# EasyEDA Pro project qsfp-booster.epro, schematic qsfp-booster
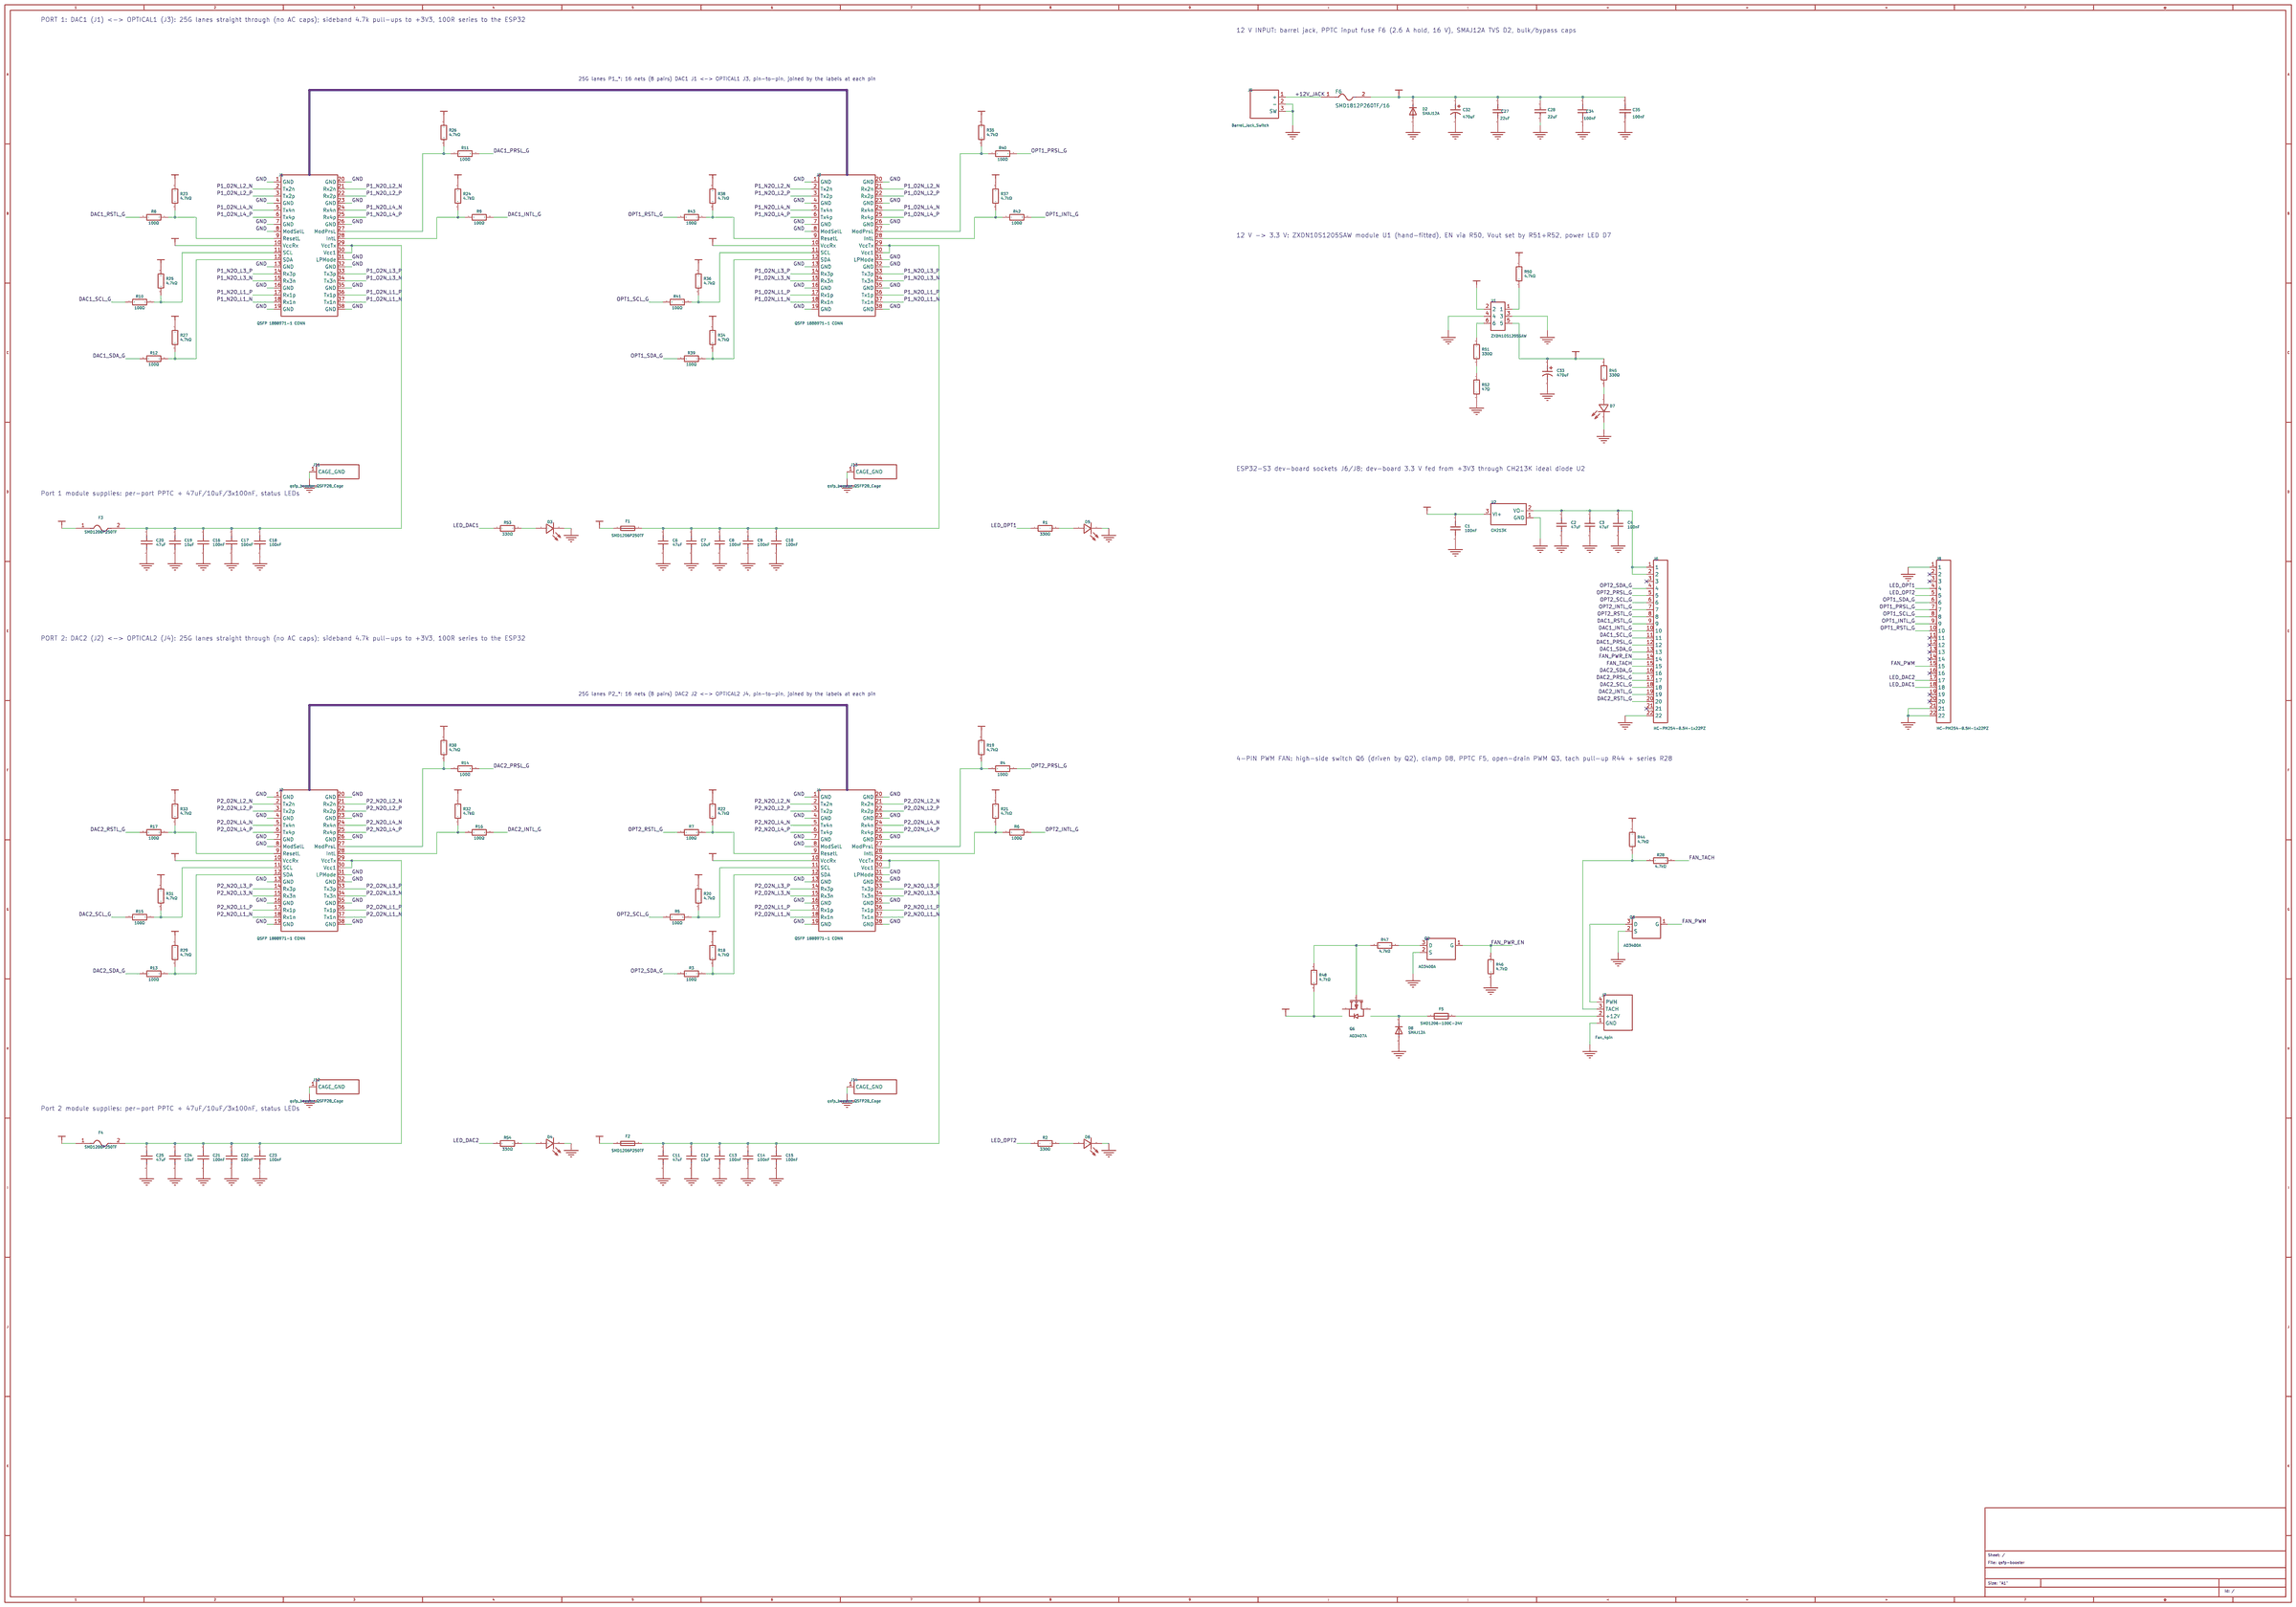
[diagram p0: schematic sheet]

## Parts
C1  100nF  [C0402]
C2  47uF
C3  47uF
C4  100nF
C6  47uF  [C1206]
C7  10uF  [C0805]
C8  100nF  [C0402]
C9  100nF  [C0402]
C10  100nF  [C0402]
C11  47uF  [C1206]
C12  10uF  [C0805]
C13  100nF  [C0402]
C14  100nF  [C0402]
C15  100nF  [C0402]
C16  100nF  [C0402]
C17  100nF  [C0402]
C18  100nF  [C0402]
C19  10uF  [C0805]
C20  47uF  [C1206]
C21  100nF  [C0402]
C22  100nF  [C0402]
C23  100nF  [C0402]
C24  10uF  [C0805]
C25  47uF  [C1206]
C27  22uF  [C1206]
C28  22uF  [C1206]
C32  470uF  [CAP-TH_BD8.0-P3.50-D1.0-FD]  (no BOM)
C33  470uF  [CAP-TH_BD8.0-P3.50-D1.0-FD]  (no BOM)
C34  100nF  [C0402]
C35  100nF  [C0402]
D2  D  [SMA_L4.3-W2.6-LS5.2-RD]
D3  KT-0603W  [LED0603-R-RD_WHITE]
D4  KT-0603W  [LED0603-R-RD_WHITE]
D5  KT-0603W  [LED0603-R-RD_WHITE]
D6  KT-0603W  [LED0603-R-RD_WHITE]
D7  KT-0603W  [LED0603-R-RD_WHITE]
D8  D  [SMA_L4.3-W2.6-LS5.2-RD]
F1  Polyfuse  [F1206]
F2  Polyfuse  [F1206]
F3  Polyfuse  [F1206]
F4  Polyfuse  [F1206]
F5  SMD1206-100C-24V  [F1206]
F6  SMD1812P260TF/16  [F1812]
J1  QSFP28_Receptacle  [CONN-SMD_QSFP-1888971-1]
J2  QSFP28_Receptacle  [CONN-SMD_QSFP-1888971-1]
J3  QSFP28_Receptacle  [CONN-SMD_QSFP-1888971-1]
J4  QSFP28_Receptacle  [CONN-SMD_QSFP-1888971-1]
J5  Barrel_Jack_Switch  [DC-IN-TH_DC-005-5A-2.0]  (no BOM)
J6  HC-PM254-8.5H-1x22PZ  [HDR-TH_22P-P2.54-V-F]  (no BOM)
J7  Fan_4pin  [CONN-TH_47053-1000]  (no BOM)
J8  HC-PM254-8.5H-1x22PZ  [HDR-TH_22P-P2.54-V-F]  (no BOM)
J11  CAGE_DAC1  [QSFP_Cage_SFF8663]  (no BOM)
J12  CAGE_DAC2  [QSFP_Cage_SFF8663]  (no BOM)
J13  CAGE_OPT1  [QSFP_Cage_SFF8663]  (no BOM)
J14  CAGE_OPT2  [QSFP_Cage_SFF8663]  (no BOM)
Q2  NMOS_GSD  [SOT-23-3_L2.9-W1.3-P1.90-LS2.4-BR]
Q3  NMOS_GSD  [SOT-23-3_L2.9-W1.3-P1.90-LS2.4-BR]
Q6  AO3407A  [SOT-23_L2.9-W1.3-P1.90-LS2.4-BR]
R1  330Ω  [R0402]
R2  330Ω  [R0402]
R3  100Ω  [R0402]
R4  100Ω  [R0402]
R5  100Ω  [R0402]
R6  100Ω  [R0402]
R7  100Ω  [R0402]
R8  100Ω  [R0402]
R9  100Ω  [R0402]
R10  100Ω  [R0402]
R11  100Ω  [R0402]
R12  100Ω  [R0402]
R13  100Ω  [R0402]
R14  100Ω  [R0402]
R15  100Ω  [R0402]
R16  100Ω  [R0402]
R17  100Ω  [R0402]
R18  4.7kΩ  [R0402]
R19  4.7kΩ  [R0402]
R20  4.7kΩ  [R0402]
R21  4.7kΩ  [R0402]
R22  4.7kΩ  [R0402]
R23  4.7kΩ  [R0402]
R24  4.7kΩ  [R0402]
R25  4.7kΩ  [R0402]
R26  4.7kΩ  [R0402]
R27  4.7kΩ  [R0402]
R28  4.7kΩ  [R0402]
R29  4.7kΩ  [R0402]
R30  4.7kΩ  [R0402]
R31  4.7kΩ  [R0402]
R32  4.7kΩ  [R0402]
R33  4.7kΩ  [R0402]
R34  4.7kΩ  [R0402]
R35  4.7kΩ  [R0402]
R36  4.7kΩ  [R0402]
R37  4.7kΩ  [R0402]
R38  4.7kΩ  [R0402]
R39  100Ω  [R0402]
R40  100Ω  [R0402]
R41  100Ω  [R0402]
R42  100Ω  [R0402]
R43  100Ω  [R0402]
R44  4.7kΩ  [R0402]
R45  330Ω  [R0402]
R46  4.7kΩ  [R0402]
R47  4.7kΩ  [R0402]
R48  4.7kΩ  [R0402]
R50  4.7kΩ  [R0402]
R51  330Ω  [R0402]
R52  47Ω  [R0402]
R53  330Ω  [R0402]
R54  330Ω  [R0402]
U1  ZXDN10S1205SAW  [COMM-SMD_ZXDN10S1205SAW]  (no BOM)
U2  CH213K  [SOT-23-3_L2.9-W1.6-P1.90-LS2.8-BR]

## Library data of the parts
C1 C8-C10 C13-C18 C21-C23 C34 C35 = CL05B104KB54PNC: 容值:100nF;精度:±10%;额定电压:50V;温度系数:X7R;; LCSC Part Name: 100nF ±10% 50V; Supplier Part: C307331; Manufacturer: SAMSUNG(三星); Supplier Footprint: 0402; JLCPCB Part Class: Basic Part; Datasheet: https://item.szlcsc.com/datasheet/CL05B104KB54PNC/291005.html; Supplier: LCSC; Tolerance: ±10%; Voltage Rating: 50V; Temperature Coefficient: X7R; PCB Layer: Default
C2 C3 = qsfp_booster_C: 容值:47uF;精度:±20%;额定电压:10V;温度系数:X5R;; LCSC Part Name: 47uF ±20% 10V; Supplier Part: C96123; Manufacturer: SAMSUNG(三星); Manufacturer Part: CL31A476MPHNNNE; Supplier Footprint: 1206; JLCPCB Part Class: Basic Part; Datasheet: https://item.szlcsc.com/datasheet/CL31A476MPHNNNE/97327.html; Supplier: LCSC; Tolerance: ±20%; Voltage Rating: 10V; Temperature Coefficient: X5R; PCB Layer: Default
C4 = qsfp_booster_C: 容值:100nF;精度:±10%;额定电压:50V;温度系数:X7R;; LCSC Part Name: 100nF ±10% 50V; Supplier Part: C307331; Manufacturer: SAMSUNG(三星); Manufacturer Part: CL05B104KB54PNC; Supplier Footprint: 0402; JLCPCB Part Class: Basic Part; Datasheet: https://item.szlcsc.com/datasheet/CL05B104KB54PNC/291005.html; Supplier: LCSC; Tolerance: ±10%; Voltage Rating: 50V; Temperature Coefficient: X7R; PCB Layer: Default
C6 C11 C20 C25 = CL31A476MPHNNNE: 容值:47uF;精度:±20%;额定电压:10V;温度系数:X5R;; LCSC Part Name: 47uF ±20% 10V; Supplier Part: C96123; Manufacturer: SAMSUNG(三星); Supplier Footprint: 1206; JLCPCB Part Class: Basic Part; Datasheet: https://item.szlcsc.com/datasheet/CL31A476MPHNNNE/97327.html; Supplier: LCSC; Tolerance: ±20%; Voltage Rating: 10V; Temperature Coefficient: X5R; PCB Layer: Default
C7 C12 C19 C24 = CL21A106KAYNNNE_C15850: 容值:10uF;精度:±10%;额定电压:25V;温度系数:X5R;; LCSC Part Name: 10uF ±10% 25V; Supplier Part: C15850; Manufacturer: SAMSUNG(三星); Manufacturer Part: CL21A106KAYNNNE; Supplier Footprint: 0805; JLCPCB Part Class: Basic Part; Datasheet: https://item.szlcsc.com/datasheet/CL21A106KAYNNNE/16532.html; Supplier: LCSC; Tolerance: ±10%; Voltage Rating: 25V; Temperature Coefficient: X5R; PCB Layer: Default
C27 C28 = CL31A226KAHNNNE: 容值:22uF;精度:±10%;额定电压:25V;温度系数:X5R;; LCSC Part Name: 22uF ±10% 25V; Supplier Part: C12891; Manufacturer: SAMSUNG(三星); Supplier Footprint: 1206; JLCPCB Part Class: Basic Part; Datasheet: https://item.szlcsc.com/datasheet/CL31A226KAHNNNE/13537.html; Supplier: LCSC; Tolerance: ±10%; Voltage Rating: 25V; Temperature Coefficient: X5R; PCB Layer: Default
C32 C33 = NXH25V470M8*15 5.0TP: 容值:470uF;精度:±20%;额定电压:25V;纹波电流:1.33A@100kHz;等效串联电阻(ESR):45mΩ@100kHz;; LCSC Part Name: 470uF ±20% 25V; Supplier Part: C2835696; Manufacturer: SAMYOUNG(韩国三莹); Supplier Footprint: 插件,D8xL15mm; JLCPCB Part Class: Extended Part; Datasheet: https://item.szlcsc.com/datasheet/NXH25V470M8*15%25205.0TP/3000472.html; Supplier: LCSC; Tolerance: ±20%; Voltage Rating: 25V; Ripple Current: 1.33A@100kHz; Equivalent Series Resistance(ESR): 45mΩ@100kHz; Pin Spacing: 3.5mm; Diameter: 8mm; Height - Seated (Max): 15mm; Lifetime: 8000hrs@105℃; Operating Temperature: -40℃~+105℃; Polarity type: 有极性; PCB Layer: Default
D2 = SMAJ12A_C148213: 极性:单向;反向截止电压(Vrwm):12V;钳位电压:19.9V;峰值脉冲电流(Ipp):20.1A@10/1000us;峰值脉冲功率(Ppp):400W@10/1000us;击穿电压(VBR):14.7V;; LCSC Part Name: 单向TVS 12V截止 峰值脉冲电流：20.1A@10/1000us; Supplier Part: C148213; Manufacturer: Littelfuse(美国力特); Manufacturer Part: SMAJ12A; Supplier Footprint: DO-214AC(SMA); JLCPCB Part Class: Extended Part; Datasheet: https://item.szlcsc.com/datasheet/SMAJ12A/159546.html; Supplier: LCSC; Polarity: 单向; Reverse Stand-Off Voltage (Vrwm): 12V; Clamping Voltage: 19.9V; Peak Pulse Current (Ipp): 20.1A@10/1000us; Peak Pulse Power Dissipation (Ppp): 400W@10/1000us; Voltage - Breakdown: 14.7V; Reverse Leakage Current (Ir): 1uA; Number of Channels: 单路; Operating Temperature: -65℃~+150℃; level of protection: IEC 61000-4-4；IEC 61000-4-2; Type: TVS; PCB Layer: Default
D3-D7 = KT-0603W: 灯头类型:1.6mmx0.8mm方形灯头;发光颜色:白色;正向压降(Vf):2.6V~3.1V;功率:100mW;正向电流:5mA;波长:-;二极管配置:独立二极管;透镜颜色:黄色透镜;色温:40000K~100000K;发光强度:360mcd;发光角度:120°;载带方式:正贴;工作温度:-40℃~+85℃;; LCSC Part Name: 0603 白灯 高亮; Supplier Part: C2290; Manufacturer: KENTO; Supplier Footprint: 0603; JLCPCB Part Class: Basic Part; Datasheet: https://item.szlcsc.com/datasheet/KT-0603W/2663.html; Supplier: LCSC; Lamp Holder Type: 1.6mmx0.8mm方形灯头; Illumination Color: 白色; Voltage - Forward(Vf): 2.6V~3.1V; Power(Watts): 100mW; Forward Current: 5mA; Diode Configuration: 独立二极管; Lens Color: 黄色透镜; Color Temperature: 40000K~100000K; Luminous Intensity: 360mcd; Viewing Angle: 120°; Mounting Style: 正贴; Operating Temperature: -40℃~+85℃; PCB Layer: Default
D8 = SMAJ12A_C148213: 极性:单向;反向截止电压(Vrwm):12V;钳位电压:19.9V;峰值脉冲电流(Ipp):20.1A@10/1000us;峰值脉冲功率(Ppp):400W@10/1000us;击穿电压(VBR):14.7V;; LCSC Part Name: 单向TVS 12V截止 峰值脉冲电流：20.1A@10/1000us; Supplier Part: C148213; Manufacturer: Littelfuse(美国力特); Manufacturer Part: SMAJ12A; Supplier Footprint: DO-214AC(SMA); JLCPCB Part Class: Extended Part; Datasheet: https://item.szlcsc.com/datasheet/SMAJ12A/159546.html; Supplier: LCSC; Polarity: 单向; Reverse Stand-Off Voltage (Vrwm): 12V; Clamping Voltage: 19.9V; Peak Pulse Current (Ipp): 20.1A@10/1000us; Peak Pulse Power Dissipation (Ppp): 400W@10/1000us; Voltage - Breakdown: 14.7V; Reverse Leakage Current (Ir): 1uA; Number of Channels: 单路; Operating Temperature: -65℃~+150℃; level of protection: IEC 61000-4-4；IEC 61000-4-2; Type: TVS; Diode Configuration: 独立式; Voltage - Forward(Vf@If): 550mV@3A; Voltage - DC Reverse(Vr): 40V; Current - Rectified: 3A; Operating Junction Temperature Range: -55℃~+125℃; Non-Repetitive Peak Forward Surge Current: 80A; PCB Layer: Default
F1-F4 = SMD1206P250TF: 耐压(Vmax):6V;最大电流(Imax):35A;保持电流(Ihold):2.5A;跳闸电流(Itrip):5A;; LCSC Part Name: 6V 35A 1206 自恢复; Supplier Part: C20803; Manufacturer: RUILON(瑞隆源); Supplier Footprint: 1206; JLCPCB Part Class: Extended Part; Datasheet: https://item.szlcsc.com/datasheet/SMD1206P250TF/21515.html; Supplier: LCSC; Voltage - Max: 6V; Current - Max: 35A; Hold Current: 2.5A; Trip Current: 5A; Power Dissipation: 800mW; Resistance - Initial (Ri) (Min): 10mΩ; Resistance - Post Trip (R1) (Max): 60mΩ; Time to Trip(Max): 2s; Operating Temperature: -40℃~+85℃; Length: 3.6mm; Width: 1.9mm; Height: 1mm; PCB Layer: Default
F5 = SMD1206-100C-24V: 耐压(Vmax):24V;最大电流(Imax):40A;保持电流(Ihold):1A;跳闸电流(Itrip):1.8A;; LCSC Part Name: 24V 1A 1206自恢复; Supplier Part: C2760272; Manufacturer: BNstar(比诺星); Supplier Footprint: 1206; JLCPCB Part Class: Extended Part; Datasheet: https://item.szlcsc.com/datasheet/SMD1206-100C-24V/2880884.html; Supplier: LCSC; Voltage - Max: 24V; Current - Max: 40A; Hold Current: 1A; Trip Current: 1.8A; Power Dissipation: 600mW; Resistance - Initial (Ri) (Min): 50mΩ; Resistance - Post Trip (R1) (Max): 300mΩ; Time to Trip(Max): 300ms; Operating Temperature: -40℃~+85℃; PCB Layer: Default
F6 = SMD1812P260TF/16: 耐压(Vmax):16V;最大电流(Imax):35A;保持电流(Ihold):2.6A;跳闸电流(Itrip):5A;; LCSC Part Name: 16V 2.6A 1812自恢复; Supplier Part: C20814; Manufacturer: RUILON(瑞隆源); Supplier Footprint: 1812; JLCPCB Part Class: Extended Part; Datasheet: https://item.szlcsc.com/datasheet/SMD1812P260TF%252F16/21526.html; Supplier: LCSC; Voltage - Max: 16V; Current - Max: 35A; Hold Current: 2.6A; Trip Current: 5A; Power Dissipation: 800mW; Resistance - Initial (Ri) (Min): 10mΩ; Resistance - Post Trip (R1) (Max): 50mΩ; Time to Trip(Max): 2.5s; Operating Temperature: -40℃~+85℃; Length: 4.73mm; Width: 3.41mm; Height: 1.5mm; PCB Layer: Default
J1-J4 = QSFP 1888971-1 CONN: QSFP+贴片卷盘 SMD 40G; Supplier Part: C52677968; Manufacturer: CND-tek(磁联达); Supplier Footprint: SMD,P=0.8mm,卧贴; JLCPCB Part Class: Extended Part; Datasheet: https://item.szlcsc.com/datasheet/QSFP%25201888971-1%2520CONN/55553957.html; Supplier: LCSC; PCB Layer: Default
J5 = DC-005-5A-2.0: 连接器类型:DC电源插座;安装方式:弯插;触点内径:2mm;触点外径:6.2mm;额定电流:5A;额定电压:24V;工作温度:-20℃~+70℃;; LCSC Part Name: DC电源插座 内径:2mm 外径:6.2mm; Supplier Part: C381116; Manufacturer: XKB Connection(中国星坤); Supplier Footprint: 插件; JLCPCB Part Class: Extended Part; Datasheet: https://item.szlcsc.com/datasheet/DC-005-5A-2.0/353348.html; Supplier: LCSC; Connector Type: DC电源插座; Mounting Type: 弯插; Inside Contact Diameter: 2mm; Outside Contact Diameter: 6.2mm; Current Rating: 5A; Voltage Rating (Max): 24V; Body Height: 11mm; Length: 14mm; Width: 9mm; Operating Temperature: -20℃~+70℃; PCB Layer: Default
J6 J8 = HC-PM254-8.5H-1x22PZ: 插孔结构:1x22P;间距:2.54mm;行距:-;圆孔/方孔:方孔;安装方式:直插;排数:单排;总孔位数:22P;额定电流:3A;额定电压:-;插孔方向:顶部;塑高:8.5mm;触头材质:黄铜;触头镀层:金;工作温度:-40℃~+105℃;; LCSC Part Name: 间距2.54mm 1x22Pin 直插 PC3.0 H8.5; Supplier Part: C41376161; Manufacturer: HC(虹成电子); Supplier Footprint: 插件,P=2.54mm; JLCPCB Part Class: Extended Part; Datasheet: https://item.szlcsc.com/datasheet/HC-PM254-8.5H-1x22PZ/43143860.html; Supplier: LCSC; Holes Structure: 1x22P; Pitch: 2.54mm; Circular Hole / Square Hole: 方孔; Mounting Type: 直插; Number of Rows: 单排; Number of Positions: 22P; Current Rating: 3A; Holes Direction: 顶部; Insulation Height: 8.5mm; Contact Material: 黄铜; Contact Plating: 金; Operating Temperature: -40℃~+105℃; PIN Length: 3mm; PCB Layer: Default
J7 = 470531000: 插针结构:1x4P;间距:2.54mm;安装方式:直插;参考系列:-;总PIN数:4P;排数:1;每排PIN数:4;行距:-;额定电流:-;触头材质:铜合金;触头镀层:锡;工作温度:-;; LCSC Part Name: 1x4P 间距:2.54mm 直插; Supplier Part: C240840; Manufacturer: MOLEX; Supplier Footprint: 插件,P=2.54mm; JLCPCB Part Class: Extended Part; Datasheet: https://www.molex.com/content/dam/molex/molex-dot-com/products/automated/en-us/salesdrawingpdf/470/47053/470531000_sd.pdf?inline\; Supplier: LCSC; Pins Structure: 1x4P; Pitch: 2.54mm; Mounting Type: 直插; Number of Pins: 4P; Number of Rows: 1; Number of PINs Per Row: 4; Contact Material: 铜合金; Contact Plating: 锡; Plastic Material: PA; Flame Retardant Rating: UL94V-2; Color: 白色; Z-Height of the Board: 7.5mm; X-Length of Bottom Edge on Board (Spacing Line): 10.2mm; Y-Width of Bottom Edge on Board: 5.84mm; PCB Layer: Default
J11 J12 = qsfp_booster_QSFP28_Cage: Standard EMI cage; MPN: CND-tek QSFP28 2170703-2 1X1H - verify drawing; LCSC: C52677971; PCB Layer: Default
J13 J14 = qsfp_booster_QSFP28_Cage: Standard EMI cage (no heatsink); MPN: CND-tek QSFP28 2170703-2 1X1H; LCSC: C52677971; PCB Layer: Default
Q2 Q3 = AO3400A_C20917: 数量:1个N沟道;漏源电压(Vdss):30V;连续漏极电流(Id):5.7A;导通电阻(RDS(on)):48mΩ@2.5V;耗散功率(Pd):1.4W;阈值电压(Vgs(th)):1.45V;; LCSC Part Name: N沟道 耐压:30V; Supplier Part: C20917; Manufacturer: AOS; Manufacturer Part: AO3400A; Supplier Footprint: SOT-23; JLCPCB Part Class: Basic Part; Datasheet: https://item.szlcsc.com/datasheet/AO3400A/21629.html; Supplier: LCSC; Number: 1个N沟道; Drain to Source Voltage: 30V; Current - Continuous Drain(Id): 5.7A; RDS(on): 48mΩ@2.5V; Pd - Power Dissipation: 1.4W; Gate Threshold Voltage (Vgs(th)): 1.45V; Gate Charge(Qg): 7nC@10V; Input Capacitance(Ciss): 630pF; Reverse Transfer Capacitance (Crss@Vds): 50pF; Operating Temperature: -55℃~+150℃; Type: N沟道; Output Capacitance(Coss): 75pF; Vgs: ±12V; PCB Layer: Default
Q6 = AO3407A_C347478: 数量:1个P沟道;漏源电压(Vdss):30V;连续漏极电流(Id):4.2A;导通电阻(RDS(on)):37mΩ@10V；52mΩ@4.5V;耗散功率(Pd):1.4W;阈值电压(Vgs(th)):1.8V;; LCSC Part Name: 1个P沟道 耐压:30V 电流:4.2A; Supplier Part: C347478; Manufacturer: UMW(友台半导体); Supplier Footprint: SOT-23; JLCPCB Part Class: Extended Part; Datasheet: https://item.szlcsc.com/datasheet/AO3407A/324138.html; Supplier: LCSC; Number: 1个P沟道; Drain to Source Voltage: 30V; Current - Continuous Drain(Id): 4.2A; RDS(on): 37mΩ@10V；52mΩ@4.5V; Pd - Power Dissipation: 1.4W; Gate Threshold Voltage (Vgs(th)): 1.8V; Gate Charge(Qg): 14.3nC@4.5V; Input Capacitance(Ciss): 700pF; Reverse Transfer Capacitance (Crss@Vds): 75pF; Output Capacitance(Coss): 80pF; PCB Layer: Default
R1 R2 R45 R51 R53 R54 = 0402WGF3300TCE: 电阻类型:厚膜电阻;阻值:330Ω;精度:±1%;功率:62.5mW;工作电压:50V;温度系数:±100ppm/℃;; LCSC Part Name: 330Ω ±1% 62.5mW 厚膜电阻; Supplier Part: C25104; Manufacturer: UNI-ROYAL(厚声); Supplier Footprint: 0402; JLCPCB Part Class: Basic Part; Datasheet: https://item.szlcsc.com/datasheet/0402WGF3300TCE/25847.html; Supplier: LCSC; Type: 厚膜电阻; Tolerance: ±1%; Power(Watts): 62.5mW; Voltage-Supply(Max): 50V; Temperature Coefficient: ±100ppm/℃; Operating Temperature: -55℃~+155℃; PCB Layer: Default
R3-R17 R39-R43 = 0402WGF1000TCE: 电阻类型:厚膜电阻;阻值:100Ω;精度:±1%;功率:62.5mW;工作电压:50V;温度系数:±100ppm/℃;; LCSC Part Name: 厚膜电阻 100Ω ±1%; Supplier Part: C25076; Manufacturer: UNI-ROYAL(厚声); Supplier Footprint: 0402; JLCPCB Part Class: Basic Part; Datasheet: https://item.szlcsc.com/datasheet/0402WGF1000TCE/25819.html; Supplier: LCSC; Type: 厚膜电阻; Tolerance: ±1%; Power(Watts): 62.5mW; Voltage-Supply(Max): 50V; Temperature Coefficient: ±100ppm/℃; Operating Temperature: -55℃~+155℃; PCB Layer: Default
R18-R38 R44 R46-R48 R50 = 0402WGF4701TCE: 电阻类型:厚膜电阻;阻值:4.7kΩ;精度:±1%;功率:62.5mW;工作电压:50V;温度系数:±100ppm/℃;; LCSC Part Name: 厚膜电阻 4.7kΩ ±1%; Supplier Part: C25900; Manufacturer: UNI-ROYAL(厚声); Supplier Footprint: 0402; JLCPCB Part Class: Basic Part; Datasheet: https://item.szlcsc.com/datasheet/0402WGF4701TCE/26643.html; Supplier: LCSC; Type: 厚膜电阻; Tolerance: ±1%; Power(Watts): 62.5mW; Voltage-Supply(Max): 50V; Temperature Coefficient: ±100ppm/℃; Operating Temperature: -55℃~+155℃; PCB Layer: Default
R52 = 0402WGF330JTCE: 电阻类型:厚膜电阻;阻值:47Ω;精度:±1%;功率:62.5mW;工作电压:50V;温度系数:±100ppm/℃;; LCSC Part Name: 47Ω ±1% 62.5mW 厚膜电阻; Supplier Part: C25118; Manufacturer: UNI-ROYAL(厚声); Manufacturer Part: 0402WGF470JTCE; Supplier Footprint: 0402; JLCPCB Part Class: Extended Part; Datasheet: https://item.szlcsc.com/datasheet/0402WGF470JTCE/25861.html; Supplier: LCSC; Type: 厚膜电阻; Tolerance: ±1%; Power(Watts): 62.5mW; Voltage-Supply(Max): 50V; Temperature Coefficient: ±100ppm/℃; Operating Temperature: -55℃~+155℃; PCB Layer: Default
U1 = PZ254V-12-06P-YL: ZTE ZXDN10S1205SAW 12V->3.3V 10A POL module (hand-soldered). 1 EN, 2 VIN, 3/4 GND, 5 VOUT, 6 ADJ. Vout=0.591*(3580+R)/(330+R), R=R51+R52=377 ohm -> 3.31 V; LCSC Part Name: 2x3P 间距:2.54mm 方针 直插; Supplier Part: C42393320; Manufacturer: ZTE; Supplier Footprint: 插件,P=2.54mm; JLCPCB Part Class: Extended Part; Datasheet: https://item.szlcsc.com/datasheet/PZ254V-12-06P-YL/44331134.html; Supplier: LCSC; Pin Structure: 2x3P; Pitch: 2.54mm; Row Spacing: 2.54mm; Circluar Pins/Square Pins: 方针; Mounting Type: 直插; Number of Rows: 双排; Number of Pins: 6P; Current Rating: 3A; Length of Mating Pin: 6.1mm; Insulation Height: 2.5mm; Length of End Connection Pin: 3mm; Contact Material: 黄铜; Operating Temperature: -40℃~+105℃; Color: 黄色; PCB Layer: Default
U2 = CH213K: CH213是一款具有限流功能的低压差理想二极管芯片。该芯片集成了过流保护、短路保护、过温保护、电源极性保护等模块。它支持5V电压下电流不超过1A的直流应用，当VO输出端出现短路等过流情况时，可通过限制输出电流来保护电源系统；当输入电源极性接反时，可保护VO输出端的负载电路; LCSC Part Name: 5V*0.5A低压降二极管芯片 停产; Supplier Part: C5456874; Manufacturer: WCH(南京沁恒); Supplier Footprint: SOT-23-3; JLCPCB Part Class: Extended Part; Datasheet: https://item.szlcsc.com/datasheet/CH213K/6369803.html; Supplier: LCSC; Input Voltage (Vin): 2.2V~5.5V; Continuous Current (Imax): 1A; FET Type: 内置FET; Number of Channels: 1; Voltage - Forward(Vf): 240mV; RDS(on): 240mΩ; Quiescent Current: 3.6uA; Operating Temperature: -40℃~+85℃; Features: 过温保护；反向极性保护；短路保护；反向电流阻断; PCB Layer: Default

## Nets
+3V3: C1.1 C33.1 F1.1 F2.1 F3.1 F4.1 R18.1 R19.1 R20.1 R21.1 R22.1 R23.1 R24.1 R25.1 R26.1 R27.1 R29.1 R30.1 R31.1 R32.1 R33.1 R34.1 R35.1 R36.1 R37.1 R38.1 R44.1 R45.1 U1.5 U2.3(VI+)
+12V: C27.1 C28.1 C32.1 C34.1 C35.1 D2.1(K) F6.2 R48.2 R50.1 U1.2
+12V_JACK: F6.1 J5.1(+)
GND: C1.2 C2.2 C3.2 C4.2 C6.2 C7.2 C8.2 C9.2 C10.2 C11.2 C12.2 C13.2 C14.2 C15.2 C16.2 C17.2 C18.2 C19.2 C20.2 C21.2 C22.2 C23.2 C24.2 C25.2 C27.2 C28.2 C32.2 C33.2 C34.2 C35.2 D2.2(A) D3.2(K) D4.2(K) D5.2(K) D6.2(K) D7.2(K) D8.2(A) J1.1(GND) J1.4(GND) J1.7(GND) J1.8(ModSelL) J1.13(GND) J1.16(GND) J1.19(GND) J1.20(GND) J1.23(GND) J1.26(GND) J1.31(LPMode) J1.32(GND) J1.35(GND) J1.38(GND) J2.1(GND) J2.4(GND) J2.7(GND) J2.8(ModSelL) J2.13(GND) J2.16(GND) J2.19(GND) J2.20(GND) J2.23(GND) J2.26(GND) J2.31(LPMode) J2.32(GND) J2.35(GND) J2.38(GND) J3.1(GND) J3.4(GND) J3.7(GND) J3.8(ModSelL) J3.13(GND) J3.16(GND) J3.19(GND) J3.20(GND) J3.23(GND) J3.26(GND) J3.31(LPMode) J3.32(GND) J3.35(GND) J3.38(GND) J4.1(GND) J4.4(GND) J4.7(GND) J4.8(ModSelL) J4.13(GND) J4.16(GND) J4.19(GND) J4.20(GND) J4.23(GND) J4.26(GND) J4.31(LPMode) J4.32(GND) J4.35(GND) J4.38(GND) J5.2(-) J5.3(SW) J6.22 J7.1(GND) J8.1 J8.21 J8.22 J11.1(CAGE_GND) J12.1(CAGE_GND) J13.1(CAGE_GND) J14.1(CAGE_GND) Q2.2(S) Q3.2(S) R46.2 R52.2 U1.3 U1.4 U2.1(GND)
VCC_DAC1: C16.1 C17.1 C18.1 C19.1 C20.1 F3.2 J1.10(VccRx) J1.29(VccTx) J1.30(Vcc1)
VCC_DAC2: C21.1 C22.1 C23.1 C24.1 C25.1 F4.2 J2.10(VccRx) J2.29(VccTx) J2.30(Vcc1)
VCC_OPT1: C6.1 C7.1 C8.1 C9.1 C10.1 F1.2 J3.10(VccRx) J3.29(VccTx) J3.30(Vcc1)
VCC_OPT2: C11.1 C12.1 C13.1 C14.1 C15.1 F2.2 J4.10(VccRx) J4.29(VccTx) J4.30(Vcc1)
DAC1_INTL: J1.28(IntL) R9.1 R24.2
DAC1_INTL_G: J6.10 R9.2
DAC1_PRSL: J1.27(ModPrsL) R11.1 R26.2
DAC1_PRSL_G: J6.12 R11.2
DAC1_RSTL: J1.9(ResetL) R8.1 R23.2
DAC1_RSTL_G: J6.9 R8.2
DAC1_SCL: J1.11(SCL) R10.1 R25.2
DAC1_SCL_G: J6.11 R10.2
DAC1_SDA: J1.12(SDA) R12.1 R27.2
DAC1_SDA_G: J6.13 R12.2
DAC2_INTL: J2.28(IntL) R16.1 R32.2
DAC2_INTL_G: J6.19 R16.2
DAC2_PRSL: J2.27(ModPrsL) R14.1 R30.2
DAC2_PRSL_G: J6.17 R14.2
DAC2_RSTL: J2.9(ResetL) R17.1 R33.2
DAC2_RSTL_G: J6.20 R17.2
DAC2_SCL: J2.11(SCL) R15.1 R31.2
DAC2_SCL_G: J6.18 R15.2
DAC2_SDA: J2.12(SDA) R13.1 R29.2
DAC2_SDA_G: J6.16 R13.2
DCDC_ADJ: R51.1 U1.6
DCDC_ADJ2: R51.2 R52.1
DCDC_EN: R50.2 U1.1
DEV_3V3: C2.1 C3.1 C4.1 J6.1 J6.2 U2.2(VO-)
FAN_12V: F5.2 J7.2(+12V)
FAN_12V_Q: D8.1(K) F5.1
FAN_PG: Q6.1(G) R47.1 R48.1
FAN_PWM: J8.15 Q3.1(G)
FAN_PWM_OUT: J7.4(PWM) Q3.3(D)
FAN_PWR_EN: J6.14 Q2.1(G) R46.1
FAN_SW_N: Q2.3(D) R47.2
FAN_TACH: J6.15 R28.2
FAN_TACH_RAW: J7.3(TACH) R28.1 R44.2
LED_DAC1: J8.18 R53.1
LED_DAC1_A: D3.1(A) R53.2
LED_DAC2: J8.17 R54.1
LED_DAC2_A: D4.1(A) R54.2
LED_OPT1: J8.4 R1.1
LED_OPT1_A: D5.1(A) R1.2
LED_OPT2: J8.5 R2.1
LED_OPT2_A: D6.1(A) R2.2
OPT1_INTL: J3.28(IntL) R37.2 R42.1
OPT1_INTL_G: J8.9 R42.2
OPT1_PRSL: J3.27(ModPrsL) R35.2 R40.1
OPT1_PRSL_G: J8.7 R40.2
OPT1_RSTL: J3.9(ResetL) R38.2 R43.1
OPT1_RSTL_G: J8.10 R43.2
OPT1_SCL: J3.11(SCL) R36.2 R41.1
OPT1_SCL_G: J8.8 R41.2
OPT1_SDA: J3.12(SDA) R34.2 R39.1
OPT1_SDA_G: J8.6 R39.2
OPT2_INTL: J4.28(IntL) R6.1 R21.2
OPT2_INTL_G: J6.7 R6.2
OPT2_PRSL: J4.27(ModPrsL) R4.1 R19.2
OPT2_PRSL_G: J6.5 R4.2
OPT2_RSTL: J4.9(ResetL) R7.1 R22.2
OPT2_RSTL_G: J6.8 R7.2
OPT2_SCL: J4.11(SCL) R5.1 R20.2
OPT2_SCL_G: J6.6 R5.2
OPT2_SDA: J4.12(SDA) R3.1 R18.2
OPT2_SDA_G: J6.4 R3.2
P1_N2O_L1_N: J1.18(Rx1n) J3.37(Tx1n)
P1_N2O_L1_P: J1.17(Rx1p) J3.36(Tx1p)
P1_N2O_L2_N: J1.21(Rx2n) J3.2(Tx2n)
P1_N2O_L2_P: J1.22(Rx2p) J3.3(Tx2p)
P1_N2O_L3_N: J1.15(Rx3n) J3.34(Tx3n)
P1_N2O_L3_P: J1.14(Rx3p) J3.33(Tx3p)
P1_N2O_L4_N: J1.24(Rx4n) J3.5(Tx4n)
P1_N2O_L4_P: J1.25(Rx4p) J3.6(Tx4p)
P1_O2N_L1_N: J1.37(Tx1n) J3.18(Rx1n)
P1_O2N_L1_P: J1.36(Tx1p) J3.17(Rx1p)
P1_O2N_L2_N: J1.2(Tx2n) J3.21(Rx2n)
P1_O2N_L2_P: J1.3(Tx2p) J3.22(Rx2p)
P1_O2N_L3_N: J1.34(Tx3n) J3.15(Rx3n)
P1_O2N_L3_P: J1.33(Tx3p) J3.14(Rx3p)
P1_O2N_L4_N: J1.5(Tx4n) J3.24(Rx4n)
P1_O2N_L4_P: J1.6(Tx4p) J3.25(Rx4p)
P2_N2O_L1_N: J2.18(Rx1n) J4.37(Tx1n)
P2_N2O_L1_P: J2.17(Rx1p) J4.36(Tx1p)
P2_N2O_L2_N: J2.21(Rx2n) J4.2(Tx2n)
P2_N2O_L2_P: J2.22(Rx2p) J4.3(Tx2p)
P2_N2O_L3_N: J2.15(Rx3n) J4.34(Tx3n)
P2_N2O_L3_P: J2.14(Rx3p) J4.33(Tx3p)
P2_N2O_L4_N: J2.24(Rx4n) J4.5(Tx4n)
P2_N2O_L4_P: J2.25(Rx4p) J4.6(Tx4p)
P2_O2N_L1_N: J2.37(Tx1n) J4.18(Rx1n)
P2_O2N_L1_P: J2.36(Tx1p) J4.17(Rx1p)
P2_O2N_L2_N: J2.2(Tx2n) J4.21(Rx2n)
P2_O2N_L2_P: J2.3(Tx2p) J4.22(Rx2p)
P2_O2N_L3_N: J2.34(Tx3n) J4.15(Rx3n)
P2_O2N_L3_P: J2.33(Tx3p) J4.14(Rx3p)
P2_O2N_L4_N: J2.5(Tx4n) J4.24(Rx4n)
P2_O2N_L4_P: J2.6(Tx4p) J4.25(Rx4p)
PWR_LED_A: D7.1(A) R45.2

Not connected (* = marked no-connect by the designer): J6 3* 21*; J8 2* 3* 11* 12* 13* 14* 16* 19* 20*; Q6 2(S) 3(D)

## Notes on the sheet
- PORT 1: DAC1 (J1) <-> OPTICAL1 (J3): 25G lanes straight through (no AC caps); sideband 4.7k pull-ups to +3V3, 100R series to the ESP32
- 12 V INPUT: barrel jack, PPTC input fuse F6 (2.6 A hold, 16 V), SMAJ12A TVS D2, bulk/bypass caps
- 25G lanes P1_*: 16 nets (8 pairs) DAC1 J1 <-> OPTICAL1 J3, pin-to-pin, joined by the labels at each pin
- 12 V -> 3.3 V: ZXDN10S1205SAW module U1 (hand-fitted), EN via R50, Vout set by R51+R52, power LED D7
- ESP32-S3 dev-board sockets J6/J8; dev-board 3.3 V fed from +3V3 through CH213K ideal diode U2
- Port 1 module supplies: per-port PPTC + 47uF/10uF/3x100nF, status LEDs
- PORT 2: DAC2 (J2) <-> OPTICAL2 (J4): 25G lanes straight through (no AC caps); sideband 4.7k pull-ups to +3V3, 100R series to the ESP32
- 25G lanes P2_*: 16 nets (8 pairs) DAC2 J2 <-> OPTICAL2 J4, pin-to-pin, joined by the labels at each pin
- 4-PIN PWM FAN: high-side switch Q6 (driven by Q2), clamp D8, PPTC F5, open-drain PWM Q3, tach pull-up R44 + series R28
- Port 2 module supplies: per-port PPTC + 47uF/10uF/3x100nF, status LEDs
